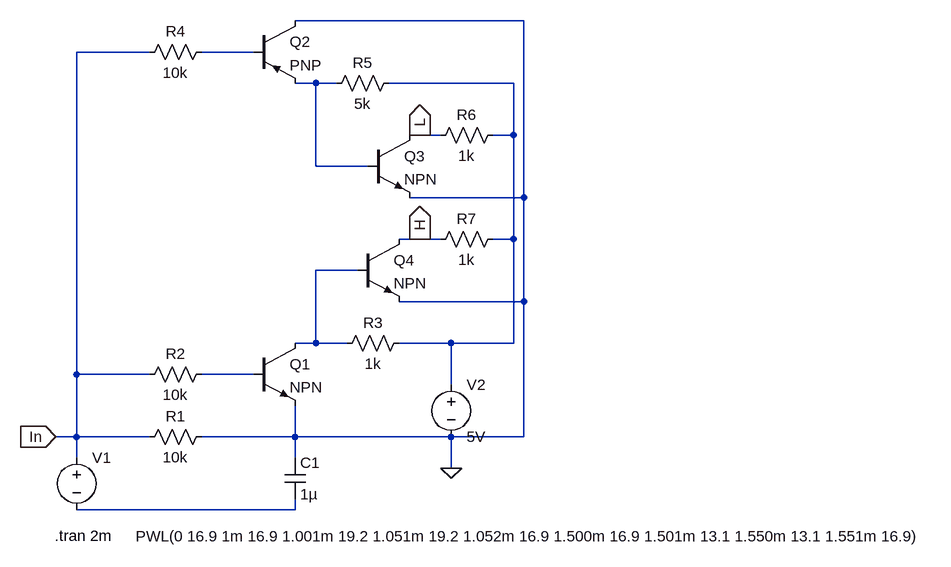
[diagram p0: schematic Pegelkonverter3.asc]
Pegelkonverter3.asc, the LTspice schematic file:
Version 4
SHEET 1 1288 680
WIRE 672 -1104 320 -1104
WIRE 96 -1056 -16 -1056
WIRE 256 -1056 176 -1056
WIRE 352 -1008 320 -1008
WIRE 384 -1008 352 -1008
WIRE 656 -1008 464 -1008
WIRE 512 -928 496 -928
WIRE 544 -928 512 -928
WIRE 656 -928 656 -1008
WIRE 656 -928 624 -928
WIRE 352 -880 352 -1008
WIRE 432 -880 352 -880
WIRE 672 -832 672 -1104
WIRE 672 -832 496 -832
WIRE 512 -768 480 -768
WIRE 544 -768 512 -768
WIRE 656 -768 656 -928
WIRE 656 -768 624 -768
WIRE 416 -720 352 -720
WIRE 672 -672 672 -832
WIRE 672 -672 480 -672
WIRE 352 -608 352 -720
WIRE 352 -608 320 -608
WIRE 400 -608 352 -608
WIRE 560 -608 480 -608
WIRE 656 -608 656 -768
WIRE 656 -608 560 -608
WIRE -16 -560 -16 -1056
WIRE 96 -560 -16 -560
WIRE 256 -560 176 -560
WIRE 560 -544 560 -608
WIRE -16 -464 -16 -560
WIRE -16 -464 -48 -464
WIRE 96 -464 -16 -464
WIRE 320 -464 320 -512
WIRE 320 -464 176 -464
WIRE 560 -464 320 -464
WIRE 672 -464 672 -672
WIRE 672 -464 560 -464
WIRE -16 -432 -16 -464
WIRE 320 -432 320 -464
WIRE 560 -416 560 -464
WIRE 320 -352 320 -368
WIRE 320 -352 -16 -352
FLAG 560 -416 0
FLAG -48 -464 In
IOPIN -48 -464 In
FLAG 512 -928 L
IOPIN 512 -928 Out
FLAG 512 -768 H
IOPIN 512 -768 Out
SYMBOL voltage -16 -448 R0
WINDOW 3 91 137 Left 2
WINDOW 123 0 0 Left 0
WINDOW 39 0 0 Left 0
SYMATTR InstName V1
SYMATTR Value PWL(0 16.9 1m 16.9 1.001m 19.2 1.051m 19.2 1.052m 16.9 1.500m 16.9 1.501m 13.1 1.550m 13.1 1.551m 16.9)
SYMBOL res 192 -480 R90
WINDOW 0 0 56 VBottom 2
WINDOW 3 32 56 VTop 2
SYMATTR InstName R1
SYMATTR Value 10k
SYMBOL cap 304 -432 R0
SYMATTR InstName C1
SYMATTR Value 1µ
SYMBOL npn 256 -608 R0
SYMATTR InstName Q1
SYMBOL res 192 -576 R90
WINDOW 0 0 56 VBottom 2
WINDOW 3 32 56 VTop 2
SYMATTR InstName R2
SYMATTR Value 10k
SYMBOL voltage 560 -560 R0
WINDOW 123 0 0 Left 0
WINDOW 39 0 0 Left 0
SYMATTR InstName V2
SYMATTR Value 5V
SYMBOL res 496 -624 R90
WINDOW 0 0 56 VBottom 2
WINDOW 3 32 56 VTop 2
SYMATTR InstName R3
SYMATTR Value 1k
SYMBOL pnp 256 -1104 R0
SYMATTR InstName Q2
SYMBOL res 192 -1072 R90
WINDOW 0 0 56 VBottom 2
WINDOW 3 32 56 VTop 2
SYMATTR InstName R4
SYMATTR Value 10k
SYMBOL res 480 -1024 R90
WINDOW 0 0 56 VBottom 2
WINDOW 3 32 56 VTop 2
SYMATTR InstName R5
SYMATTR Value 5k
SYMBOL npn 432 -928 R0
SYMATTR InstName Q3
SYMBOL res 640 -944 R90
WINDOW 0 0 56 VBottom 2
WINDOW 3 32 56 VTop 2
SYMATTR InstName R6
SYMATTR Value 1k
SYMBOL npn 416 -768 R0
SYMATTR InstName Q4
SYMBOL res 640 -784 R90
WINDOW 0 0 56 VBottom 2
WINDOW 3 32 56 VTop 2
SYMATTR InstName R7
SYMATTR Value 1k
TEXT -50 -312 Left 2 !.tran 2m

The netlist it stands for:
* Pegelkonverter3.asc
V1 In N006 PWL(0 16.9 1m 16.9 1.001m 19.2 1.051m 19.2 1.052m 16.9 1.500m 16.9 1.501m 13.1 1.550m 13.1 1.551m 16.9)
R1 0 In 10k
C1 0 N006 1µ
Q1 N004 N005 0 0 NPN
R2 N005 In 10k
V2 N003 0 5V
R3 N003 N004 1k
Q2 0 N001 N002 0 PNP
R4 N001 In 10k
R5 N003 N002 5k
Q3 L N002 0 0 NPN
R6 N003 L 1k
Q4 H N004 0 0 NPN
R7 N003 H 1k
.model NPN NPN
.model PNP PNP
.lib standard.bjt
.tran 2m
.backanno
.end